# Altium schematic sheet POWER SOURCE.SchDoc
size A4; Date: 10/10/2026; DrawnBy: Juan Alejandro Villodres Perdomo; Revision: 0.1; SheetNumber: 4; SheetTotal: 5
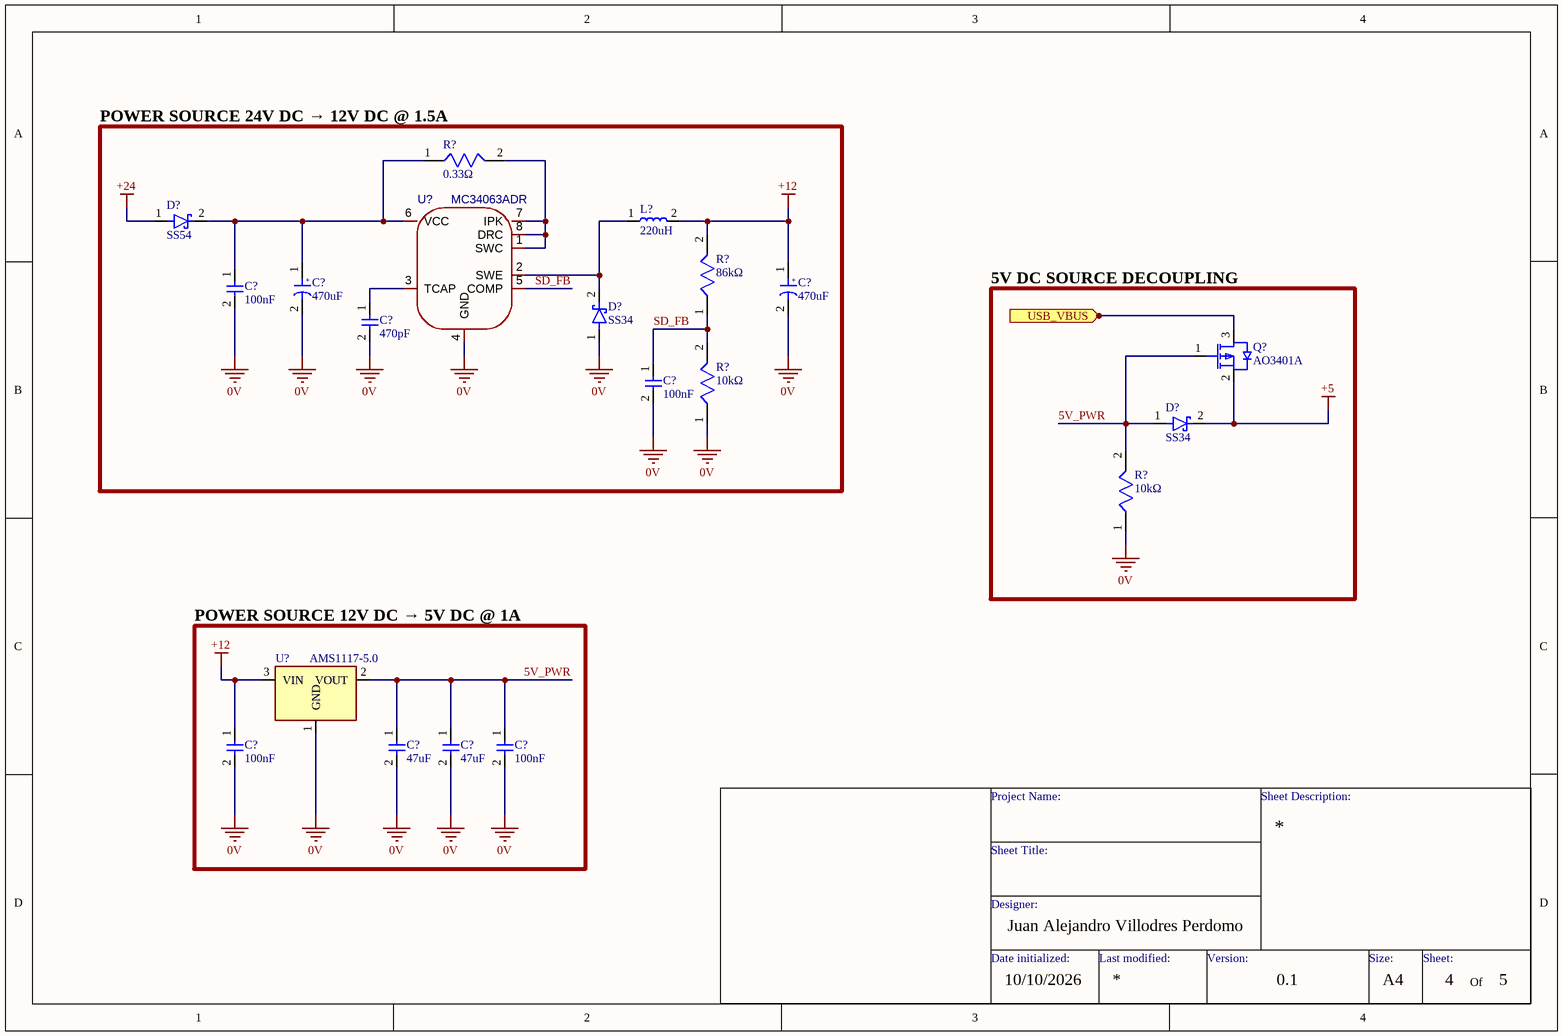
[diagram p0: POWER SOURCE.SchDoc]

## Parts
(Parts that share a designator on the sheet are numbered #1, #2 ... from top to bottom, then left to right.)
C?#1  100nF  [CAPC1608X90N]
C?#2  470uF  [CAPAE1030X1100N]
C?#3  470uF  [CAPAE1030X1100N]
C?#4  470pF  [CAPC1608X90N]
C?#5  100nF  [CAPC1005X55L]
C?#6  100nF  [CAPC1005X55L]
C?#7  47uF  [CAPC3216X180L]
C?#8  47uF  [CAPC3216X180L]
C?#9  100nF  [CAPC1005X55L]
D?#1  SS54  [DIOM4226X245N]
D?#2  SS34  [DIOM4226X245N]
D?#3  SS34  [DIOM4226X245N]
L?  220uH  [IND-SMD_L10.0-W10.0-1]
Q?  AO3401A  [SOT95P230X121-3N]
R?#1  0.33Ω  [RESC3216X58N]
R?#2  86kΩ  [RESC1608X47N]
R?#3  10kΩ  [RESC1608X47N]
R?#4  10kΩ  [RESC1608X47N]
U?#1  MC34063ADR  [SOIC-8_L4.9-W3.9-P1.27-LS6.0-BL]
U?#2  AMS1117-5.0  [SOT230P700X180-4N]

## Blocks framed on the sheet
POWER SOURCE 24V DC → 12V DC @ 1.5A: C?#1-C?#5 D?#1 D?#2 L? R?#1-R?#3 U?#1
5V DC SOURCE DECOUPLING: D?#3 Q? R?#4
POWER SOURCE 12V DC → 5V DC @ 1A: C?#6-C?#9 U?#2

## Ports
USB_VBUS (in, see MCU[4A])

## Nets
0V: C?#1.2 C?#2.2 C?#3.2 C?#4.2 C?#5.2 C?#6.2 C?#7.2 C?#8.2 C?#9.2 D?#2.1 R?#3.1 R?#4.1 U?#1.4(GND) U?#2.1(GND)
+5: D?#3.2 Q?.2(S)
+12: C?#3.1 C?#6.1 L?.2 R?#2.2 U?#2.3(VIN)
+24: D?#1.1
5V_PWR: C?#7.1 C?#8.1 C?#9.1 D?#3.1 Q?.1(G) R?#4.2 U?#2.2(VOUT)
SD_FB: C?#5.1 R?#2.1 R?#3.2 U?#1.5(COMP)
USB_VBUS: Q?.3(D) ; port USB_VBUS
NetC?#1_1: C?#1.1 C?#2.1 D?#1.2 R?#1.1 U?#1.6(VCC)
NetC?#4_1: C?#4.1 U?#1.3(TCAP)
NetD?#2_2: D?#2.2 L?.1 U?#1.2(SWE)
NetR?#1_2: R?#1.2 U?#1.1(SWC) U?#1.7(IPK) U?#1.8(DRC)

## Notes on the sheet
- Project Name:
- Sheet Description:
- Sheet Title:
- Designer:
- Date initialized:
- Last modified:
- Version:
- Size:
- A4
- Sheet:
- Of
- (in symbol CAP_10x10_35V) +

## Library data of the parts
C?#1 = CAP_0603_50V: Capacitor SMD 0603 / 100nF / 50V; SupplierPart: C14663
C?#2 C?#3 = CAP_10x10_35V: Capacitor Aluminum Electrolytic SMD 10x10 / 470uF / 35V; SupplierPart: C46550413
C?#4 = CAP_0603_50V: Capacitor SMD 0603 / 470pF / 50V; SupplierPart: C1620
C?#5 C?#6 C?#9 = CAP_0402_16V: Capacitor SMD 0402 / 100nF / 16V; SupplierPart: C1525
C?#7 C?#8 = CAP_1206_10V: Capacitor SMD 1206 / 47uF / 10V; SupplierPart: C96123
D?#1 = DIODE_SCH: Diode Schottky SMD / SMA(DO-214AC) / SS54 / 5A; SupplierPart: C22452
D?#2 D?#3 = DIODE_SCH: Diode Schottky SMD / SMA(DO-214AC) / SS34 / 3A; SupplierPart: C8678
L? = IND_SNR_1050: Inductor SMD 10x10 / 220uH / 1A; SupplierPart: C3007721
Q? = AO3401A: 1 P-Channel 14nC@10V 30V 47mΩ@10V、60mΩ@4.5V、85mΩ@2.5V 4A 55pF 645pF 80pF 900mV SOT-23 MOSFETs ROHS; SupplierPart: C15127
R?#1 = RES_1206: Resistor SMD 1206 / 0.33Ω / 1W; SupplierPart: C5824529
R?#2 = RES_0603: Resistor SMD 0603 / 86kΩ / 62.5mW; SupplierPart: C5137135
R?#3 R?#4 = RES_0603: Resistor SMD 0603 / 10kΩ / 100mW; SupplierPart: C25804
U?#1 = MC34063ADR: Function:Boost；Step-down type Voltage - Supply:3V~40V Voltage - Supply:3V~40V Output Voltage:- Output Voltage:- Output Current:1.5A Frequency - Switching:100kHz Frequency - Switching:100kHz Operating Temperature:0℃~+70℃@(TA) Operating Temperature:0℃~+70℃@; Manufacturer: TI(德州仪器); AddInBom: yes; ModelId: 2ec1ac1bf9bf4d09a988fcee15e6a02dÂŽ0819f05c4eef4c71ace90d822a990e87; ModelName: SOIC-8_L4.9-W3.9-H1.7-LS6.0-P1.27; ModelTransform: 192.913,236.22,0,0,0,0,0,0,0; Voltage - Supply: 3V~40V; Output Current: 1.5A; Frequency - Switching: 100kHz; Synchronous Rectifier: No; Number of Outputs: 1; Topology: Buck；Boost；Inverting; Switch tube (built-in/external): Built-in; Output Type: Adjustable; Symbol: MC34063ADR; Device: MC34063ADR; LCSC Part Name: 降压型 1.5A 3V~40V; SupplierPart: C100023; ManufacturerPart: MC34063ADR; Supplier Footprint: SOIC-8; JLCPCB Part Class: Extended Part; Datasheet: https://www.ti.com/cn/lit/ds/symlink/mc33063a.pdf; Supplier: LCSC; ConvertToPcb: yes; FootprintName: SOIC-8_L4.9-W3.9-P1.27-LS6.0-BL; Function: Boost；Step-down type; Output Voltage: -; Operating Temperature: 0℃~+70℃@(TA); Quiescent Current: -; Features: Overcurrent Protection
U?#2 = AMS1117-5.0: -40℃~+125℃ 1 1.3V 15V 1A 5V 60dB Fixed Positive Short Circuit Protection、Thermal shutdown SOT-223 Voltage Regulators - Linear, Low Drop Out (LDO) Regulators ROHS; SupplierPart: C6187